# Altium project Palm_V2.2.PrjPcb (part 1 of 3)
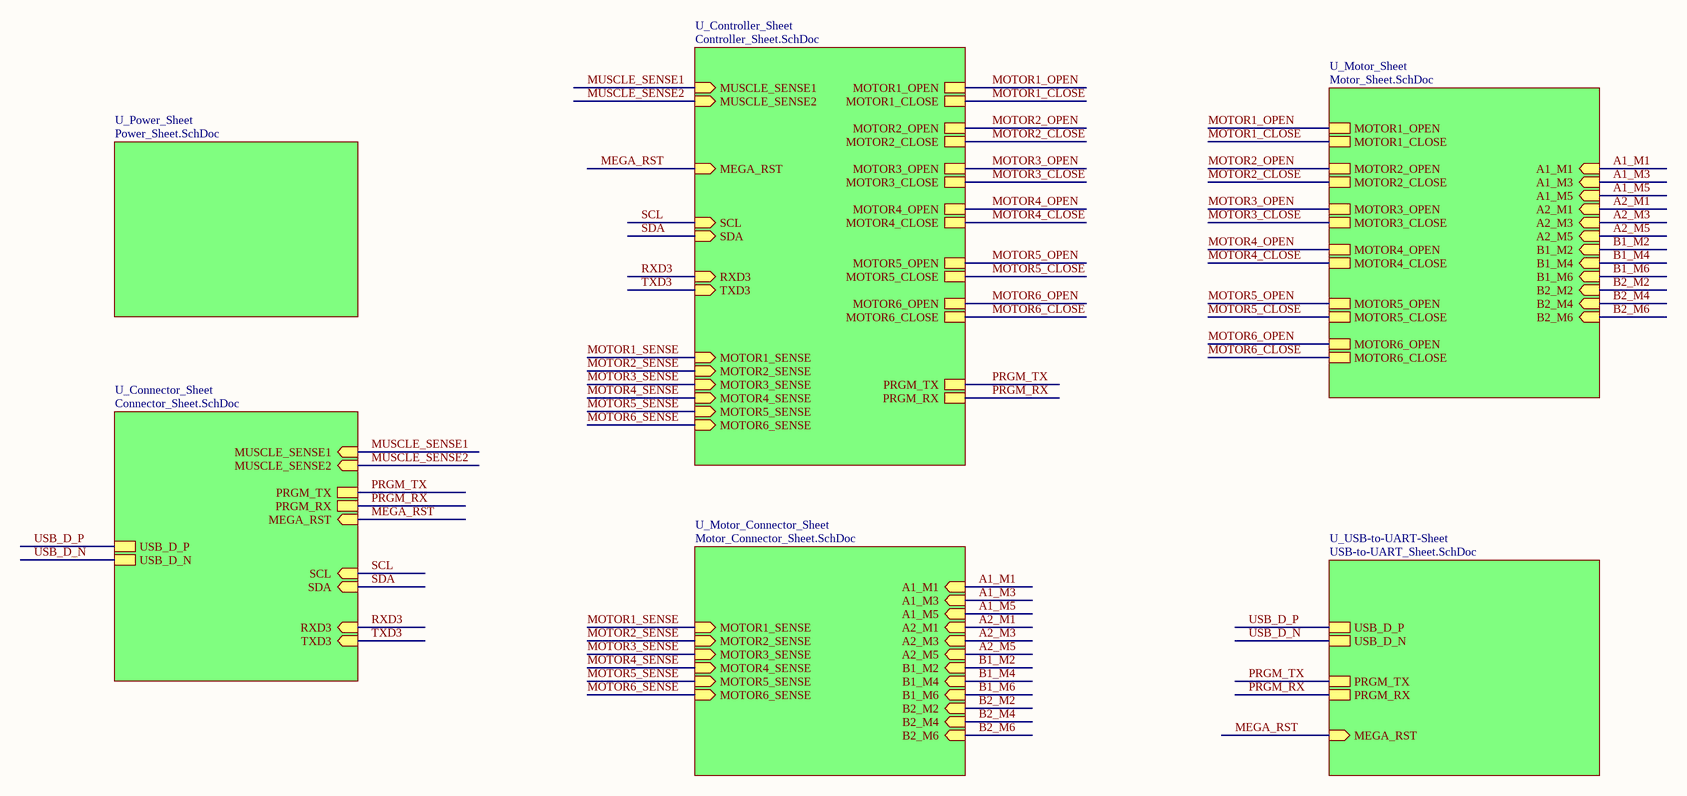
[diagram p0: Top_Sheet.SchDoc]
7 sheets, 124 parts. Net scope: hierarchical (ports join the sheet entries above them; power ports are global).
Board file: PCB_Palm_v2.2.PcbDoc
Sheets:
  Top_Sheet.SchDoc
    U_Power_Sheet = Power_Sheet.SchDoc
    U_Connector_Sheet = Connector_Sheet.SchDoc
    U_Motor_Connector_Sheet = Motor_Connector_Sheet.SchDoc
    U_Controller_Sheet = Controller_Sheet.SchDoc
    U_Motor_Sheet = Motor_Sheet.SchDoc
    U_USB-to-UART-Sheet = USB-to-UART_Sheet.SchDoc

## Sheet Top_Sheet.SchDoc
size B; DocumentNumber: 1; SheetNumber: 1; SheetTotal: 7

### Sub-sheets
U_Connector_Sheet = Connector_Sheet.SchDoc: MUSCLE_SENSE1 (in), SCL (in), SDA (in), MUSCLE_SENSE2 (in), RXD3 (in), TXD3 (in), PRGM_TX, PRGM_RX, MEGA_RST (in), USB_D_P, USB_D_N
U_Controller_Sheet = Controller_Sheet.SchDoc: MOTOR1_SENSE (in), MOTOR2_SENSE (in), MOTOR3_SENSE (in), MOTOR4_SENSE (in), MOTOR5_SENSE (in), MOTOR6_SENSE (in), MOTOR5_OPEN, MOTOR5_CLOSE, MOTOR6_OPEN, MOTOR6_CLOSE, MOTOR1_OPEN, MOTOR1_CLOSE, MOTOR2_OPEN, MOTOR2_CLOSE, MOTOR3_OPEN, MOTOR3_CLOSE, MOTOR4_OPEN, MOTOR4_CLOSE, SCL (in), SDA (in), RXD3 (in), TXD3 (in), MEGA_RST (in), MUSCLE_SENSE1 (in), MUSCLE_SENSE2 (in), PRGM_RX, PRGM_TX
U_Motor_Connector_Sheet = Motor_Connector_Sheet.SchDoc: MOTOR1_SENSE (in), MOTOR2_SENSE (in), MOTOR3_SENSE (in), MOTOR4_SENSE (in), MOTOR5_SENSE (in), MOTOR6_SENSE (in), B1_M6 (in), B2_M6 (in), A1_M5 (in), A2_M5 (in), B1_M4 (in), B2_M4 (in), A2_M3 (in), A1_M3 (in), B2_M2 (in), B1_M2 (in), A2_M1 (in), A1_M1 (in)
U_Motor_Sheet = Motor_Sheet.SchDoc: B2_M6 (in), B1_M6 (in), A2_M5 (in), A1_M5 (in), B2_M4 (in), B1_M4 (in), A2_M3 (in), A1_M3 (in), B2_M2 (in), B1_M2 (in), A2_M1 (in), A1_M1 (in), MOTOR6_CLOSE, MOTOR2_CLOSE, MOTOR2_OPEN, MOTOR4_OPEN, MOTOR5_CLOSE, MOTOR3_OPEN, MOTOR1_OPEN, MOTOR4_CLOSE, MOTOR3_CLOSE, MOTOR6_OPEN, MOTOR1_CLOSE, MOTOR5_OPEN
U_Power_Sheet = Power_Sheet.SchDoc: no entries
U_USB-to-UART-Sheet = USB-to-UART_Sheet.SchDoc: USB_D_P, USB_D_N, PRGM_RX, PRGM_TX, MEGA_RST (in)

### Nets
A1_M1: sheet U_Motor_Connector_Sheet/A1_M1, sheet U_Motor_Sheet/A1_M1
A1_M3: sheet U_Motor_Connector_Sheet/A1_M3, sheet U_Motor_Sheet/A1_M3
A1_M5: sheet U_Motor_Connector_Sheet/A1_M5, sheet U_Motor_Sheet/A1_M5
A2_M1: sheet U_Motor_Connector_Sheet/A2_M1, sheet U_Motor_Sheet/A2_M1
A2_M3: sheet U_Motor_Connector_Sheet/A2_M3, sheet U_Motor_Sheet/A2_M3
A2_M5: sheet U_Motor_Connector_Sheet/A2_M5, sheet U_Motor_Sheet/A2_M5
B1_M2: sheet U_Motor_Connector_Sheet/B1_M2, sheet U_Motor_Sheet/B1_M2
B1_M4: sheet U_Motor_Connector_Sheet/B1_M4, sheet U_Motor_Sheet/B1_M4
B1_M6: sheet U_Motor_Connector_Sheet/B1_M6, sheet U_Motor_Sheet/B1_M6
B2_M2: sheet U_Motor_Connector_Sheet/B2_M2, sheet U_Motor_Sheet/B2_M2
B2_M4: sheet U_Motor_Connector_Sheet/B2_M4, sheet U_Motor_Sheet/B2_M4
B2_M6: sheet U_Motor_Connector_Sheet/B2_M6, sheet U_Motor_Sheet/B2_M6
MEGA_RST: sheet U_Connector_Sheet/MEGA_RST, sheet U_Controller_Sheet/MEGA_RST, sheet U_USB-to-UART-Sheet/MEGA_RST
MOTOR1_CLOSE: sheet U_Controller_Sheet/MOTOR1_CLOSE, sheet U_Motor_Sheet/MOTOR1_CLOSE
MOTOR1_OPEN: sheet U_Controller_Sheet/MOTOR1_OPEN, sheet U_Motor_Sheet/MOTOR1_OPEN
MOTOR1_SENSE: sheet U_Motor_Connector_Sheet/MOTOR1_SENSE, sheet U_Controller_Sheet/MOTOR1_SENSE
MOTOR2_CLOSE: sheet U_Controller_Sheet/MOTOR2_CLOSE, sheet U_Motor_Sheet/MOTOR2_CLOSE
MOTOR2_OPEN: sheet U_Controller_Sheet/MOTOR2_OPEN, sheet U_Motor_Sheet/MOTOR2_OPEN
MOTOR2_SENSE: sheet U_Motor_Connector_Sheet/MOTOR2_SENSE, sheet U_Controller_Sheet/MOTOR2_SENSE
MOTOR3_CLOSE: sheet U_Controller_Sheet/MOTOR3_CLOSE, sheet U_Motor_Sheet/MOTOR3_CLOSE
MOTOR3_OPEN: sheet U_Controller_Sheet/MOTOR3_OPEN, sheet U_Motor_Sheet/MOTOR3_OPEN
MOTOR3_SENSE: sheet U_Motor_Connector_Sheet/MOTOR3_SENSE, sheet U_Controller_Sheet/MOTOR3_SENSE
MOTOR4_CLOSE: sheet U_Controller_Sheet/MOTOR4_CLOSE, sheet U_Motor_Sheet/MOTOR4_CLOSE
MOTOR4_OPEN: sheet U_Controller_Sheet/MOTOR4_OPEN, sheet U_Motor_Sheet/MOTOR4_OPEN
MOTOR4_SENSE: sheet U_Motor_Connector_Sheet/MOTOR4_SENSE, sheet U_Controller_Sheet/MOTOR4_SENSE
MOTOR5_CLOSE: sheet U_Controller_Sheet/MOTOR5_CLOSE, sheet U_Motor_Sheet/MOTOR5_CLOSE
MOTOR5_OPEN: sheet U_Controller_Sheet/MOTOR5_OPEN, sheet U_Motor_Sheet/MOTOR5_OPEN
MOTOR5_SENSE: sheet U_Motor_Connector_Sheet/MOTOR5_SENSE, sheet U_Controller_Sheet/MOTOR5_SENSE
MOTOR6_CLOSE: sheet U_Controller_Sheet/MOTOR6_CLOSE, sheet U_Motor_Sheet/MOTOR6_CLOSE
MOTOR6_OPEN: sheet U_Controller_Sheet/MOTOR6_OPEN, sheet U_Motor_Sheet/MOTOR6_OPEN
MOTOR6_SENSE: sheet U_Motor_Connector_Sheet/MOTOR6_SENSE, sheet U_Controller_Sheet/MOTOR6_SENSE
MUSCLE_SENSE1: sheet U_Connector_Sheet/MUSCLE_SENSE1, sheet U_Controller_Sheet/MUSCLE_SENSE1
MUSCLE_SENSE2: sheet U_Connector_Sheet/MUSCLE_SENSE2, sheet U_Controller_Sheet/MUSCLE_SENSE2
PRGM_RX: sheet U_Connector_Sheet/PRGM_RX, sheet U_Controller_Sheet/PRGM_RX, sheet U_USB-to-UART-Sheet/PRGM_RX
PRGM_TX: sheet U_Connector_Sheet/PRGM_TX, sheet U_Controller_Sheet/PRGM_TX, sheet U_USB-to-UART-Sheet/PRGM_TX
RXD3: sheet U_Connector_Sheet/RXD3, sheet U_Controller_Sheet/RXD3
SCL: sheet U_Connector_Sheet/SCL, sheet U_Controller_Sheet/SCL
SDA: sheet U_Connector_Sheet/SDA, sheet U_Controller_Sheet/SDA
TXD3: sheet U_Connector_Sheet/TXD3, sheet U_Controller_Sheet/TXD3
USB_D_N: sheet U_Connector_Sheet/USB_D_N, sheet U_USB-to-UART-Sheet/USB_D_N
USB_D_P: sheet U_Connector_Sheet/USB_D_P, sheet U_USB-to-UART-Sheet/USB_D_P

## Sheet Power_Sheet.SchDoc
size A; DocumentNumber: 2; SheetNumber: 2; SheetTotal: 7
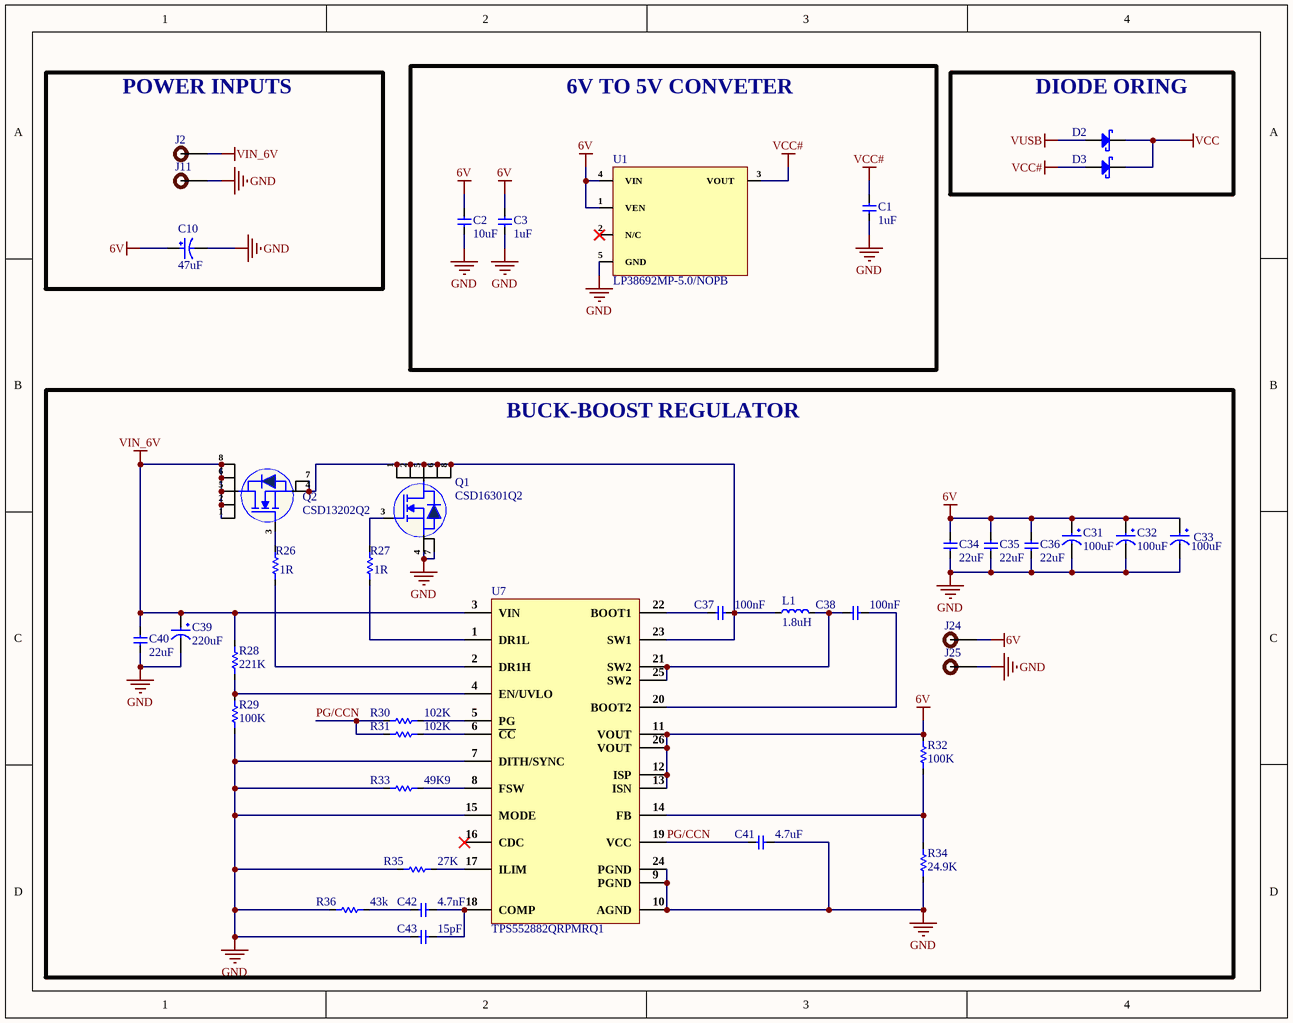
[diagram p1: Power_Sheet.SchDoc]

### Parts
C1  1uF  [Cap-0402]
C2  10uF  [Cap-0402]
C3  1uF  [Cap-0402]
C10  47uF  [Case-D]
C31  100uF  [Case-E]
C32  100uF  [Case-E]
C33  100uF  [Case-E]
C34  22uF  [Cap-0603]
C35  22uF  [Cap-0603]
C36  22uF  [Cap-0603]
C37  100nF  [Cap-0402]
C38  100nF  [Cap-0402]
C39  220uF  [Case-D]
C40  22uF  [Cap-0603]
C41  4.7uF  [Cap-0603]
C42  4.7nF  [Cap-0603]
C43  15pF  [Cap-0603]
D2  SS54B-HF  [SMB_]  (value not drawn)
D3  SS54B-HF  [SMB_]  (value not drawn)
J2  Test Point -TH 1.8mm Hole size 0.92mm  [Test Point -TH 1.8mm Hole size 0.92mm]  (value not drawn)  (no BOM)
J11  Test Point -TH 1.8mm Hole size 0.92mm  [Test Point -TH 1.8mm Hole size 0.92mm]  (value not drawn)  (no BOM)
J24  Test Point -TH 1.8mm Hole size 0.92mm  [Test Point -TH 1.8mm Hole size 0.92mm]  (value not drawn)  (no BOM)
J25  Test Point -TH 1.8mm Hole size 0.92mm  [Test Point -TH 1.8mm Hole size 0.92mm]  (value not drawn)  (no BOM)
L1  1.8uH  [YSPIT0770A-1R8M]
Q1  CSD16301Q2  [CSD17313Q2]
Q2  CSD13202Q2  [CSD17313Q2]
R26  1R  [Res-0603]
R27  1R  [Res-0603]
R28  221K  [Res-0603]
R29  100K  [Res-0603]
R30  102K  [Res-0603]
R31  102K  [Res-0603]
R32  100K  [Res-0603]
R33  49K9  [Res-0603]
R34  24.9K  [Res-0402]
R35  27K  [Res-0603]
R36  43k  [Res-0402]
U1  LP38692MP-5.0/NOPB  [SOT-223-5]
U7  TPS552882QRPMRQ1  [26-VQFN-HR (4x3.5)]

### Blocks framed on the sheet
POWER INPUTS: C10 J2 J11
6V TO 5V CONVETER: C1-C3 U1
DIODE ORING: D2 D3
BUCK-BOOST REGULATOR: C31-C43 J24 J25 L1 Q1 Q2 R26-R36 U7

### Nets
6V: C2.2 C3.2 C10.1 C31.1 C32.1 C33.1 C34.2 C35.2 C36.2 J24.1 R32.2 U1.1(VEN) U1.4(VIN) U7.11(VOUT) U7.12(ISP) U7.13(ISN) U7.26(VOUT)
GND: C1.1 C2.1 C3.1 C10.2 C31.2 C32.2 C33.2 C34.1 C35.1 C36.1 C39.2 C40.1 C41.2 C43.1 J11.1 J25.1 Q1.4(S) Q1.7(S) R29.1 R33.1 R34.1 R35.1 R36.1 U1.5(GND) U7.7(DITH/SYNC) U7.9(PGND) U7.10(AGND) U7.15(MODE) U7.24(PGND)
VCC: D2.2(K) D3.2(K)
VCC#: C1.2 D3.1(A) U1.3(VOUT)
VIN_6V: C39.1 C40.2 J2.1 Q2.1(D) Q2.2(D) Q2.5(D) Q2.6(D) Q2.8(D) R28.2 U7.3(VIN)
VUSB: D2.1(A)
PG/CCN: C41.1 R30.1 R31.1 U7.19(VCC)
NetC37_1: C37.1 U7.22(BOOT1)
NetC37_2: C37.2 L1.1 Q1.1(D) Q1.2(D) Q1.5(D) Q1.6(D) Q1.8(D) Q2.4(S) Q2.7(S) U7.23(SW1)
NetC38_1: C38.1 L1.2 U7.21(SW2) U7.25(SW2)
NetC38_2: C38.2 U7.20(BOOT2)
NetC42_1: C42.1 R36.2
NetC42_2: C42.2 C43.2 U7.18(COMP)
NetQ1_3: Q1.3(G) R27.2
NetQ2_3: Q2.3(G) R26.2
NetR26_1: R26.1 U7.2(DR1H)
NetR27_1: R27.1 U7.1(DR1L)
NetR28_1: R28.1 R29.2 U7.4(EN/UVLO)
NetR30_2: R30.2 U7.5(PG)
NetR31_2: R31.2 U7.6(~{CC})
NetR32_1: R32.1 R34.2 U7.14(FB)
NetR33_2: R33.2 U7.8(FSW)
NetR35_2: R35.2 U7.17(ILIM)

Not connected (* = marked no-connect by the designer): U1 2(N/C)*; U7 16(CDC)*

### Library data of the parts
C1 C3 = CC0402KRX5R6BB105: CAP CER 1UF 10V X5R 0402; Manufacturer: Yageo; Tolerance: 10%; Dissipation Factor: 15%; Item Type: Capacitor; Supplier 1: Mouser; Manufacturer Part Number: CC0402KRX5R6BB105; RoHS: Yes; Category: Ceramic Capacitors; Stock 1: 6711367; Pricing 1: 1=0.11000, 10=0.05500, 50=0.05500, 100=0.03300, 500=0.02700, 1000=0.02200, 2500=0.02100, 10000=0.01800 (USD); Mount: Surface Mount; Case/Package: 0402; Number of Pins: 2; Case Code (Metric): 1005; Case Code (Imperial): 0402; Min Operating Temperature: -55°C; Max Operating Temperature: 85°C; Capacitance: 1uF; Dielectric: X5R; Package Quantity: 1; Voltage Rating: 10V; Packaging: Tape and Reel; Voltage Rating (DC): 10V; Termination: SMD/SMT; Resistor Type: Ceramic; Series: CC; Construction: Flat; Length: 1mm; Width: 0.02inch; Height: 0.5mm; Thickness: 0.022inch; Depth: 0.5mm; Radiation Hardening: No; REACH SVHC: No SVHC; Lead Free: Lead Free; Halogen Free: Halogen Free; RoHS Compliant: Yes; ComponentLink1URL: https://datasheet.ciiva.com/176/upy-gphc-x5r-4v-to-50v-12-176704.pdf?src-supplier=Digi-Key; ComponentLink1Description: https://datasheet.ciiva.com/176/upy-gphc-x5r-4v-to-50v-12-176704.pdf?src-supplier=Digi-Key; ComponentLink2URL: https://datasheet.ciiva.com/176/mlccorderingcode-176705.pdf?src-supplier=Digi-Key; ComponentLink2Description: https://datasheet.ciiva.com/176/mlccorderingcode-176705.pdf?src-supplier=Digi-Key; ComponentLink3URL: https://datasheet.ciiva.com/176/mlccorderingcode-176706.pdf?src-supplier=Digi-Key; ComponentLink3Description: https://datasheet.ciiva.com/176/mlccorderingcode-176706.pdf?src-supplier=Digi-Key; Supplier Part Number 1: 603-CC402KRX5R6BB105; LCSC Part Number: C106254
C2 = CC0402MRX5R6BB106: CAP CER 10UF 10V X5R 0402; Manufacturer: Yageo; Tolerance: 20%; Item Type: Capacitor; Supplier 1: Future Electronics; Manufacturer Part Number: CC0402MRX5R6BB106; RoHS: Yes; Category: Ceramic Capacitors; Stock 1: 80000; Pricing 1: 10000=0.02650, 20000=0.02590, 30000=0.02550, 40000=0.02530, 50000=0.02450 (USD); Mount: Surface Mount; Case/Package: 0402; Case Code (Imperial): 0402; Case Code (Metric): 1005; Min Operating Temperature: -55°C; Max Operating Temperature: 85°C; Packaging: Tape and Reel; Capacitance: 10uF; Voltage Rating: 10V; RoHS Compliant: Yes; ComponentLink1URL: http://www.yageo.com/documents/recent/UPY-GPHC_X5R_4V-to-50V_25.pdf?src-supplier=Digi-Key; ComponentLink1Description: http://www.yageo.com/documents/recent/UPY-GPHC_X5R_4V-to-50V_25.pdf?src-supplier=Digi-Key; Supplier Part Number 1: 6097631; LCSC Part Number: C962143
C10 = CA45-D025K476T: 47uF 25V 0.9Ω@100kHz ±10% CASE-D-7343 Tantalum Capacitors ROHS; Manufacturer: Hunan Xiangyee in S&T; Manufacturer Part Number: CA45-D025K476T; ComponentLink1URL: https://www.lcsc.com/product-detail/Tantalum-Capacitors_Hunan-Xiangyee-in-S-T-CA45-D025K476T_C123267.html; ComponentLink1Description: LCSC; LCSC Part Number: C123267; Item Type: Capacitor; Package: CASE-D-7343
C31-C33 = TAJE107M025RNJ: CAP TANT 100UF 20% 25V 2917; Manufacturer: Kyocera AVX; ESR (Equivalent Series Resistance): 300mR; Leakage Current: 25uA; Polarity: Polar; Dissipation Factor: 10%; Supplier 1: Mouser; Manufacturer Part Number: TAJE107M025RNJ; RoHS: Yes; Category: Tantalum Capacitors; Stock 1: 109; Pricing 1: 1=2.81000, 10=2.81000, 50=2.81000, 100=2.19000, 1000=1.76000, 10000=1.76000 (USD); Mount: Surface Mount; Case/Package: 2917; Number of Pins: 2; Case Code (Imperial): 2917; Case Code (Metric): 7343; Min Operating Temperature: -55°C; Max Operating Temperature: 125°C; Capacitance: 100uF; Tolerance: 20%; Packaging: Tape and Reel; Voltage Rating: 25V; Voltage Rating (DC): 25V; Features: General Purpose; Package Quantity: 1; Termination: SMD/SMT; Series: TAJ; Construction: Flat; Length: 7.3mm; Width: 4.3mm; Height: 4.3mm; Depth: 4.3mm; Height - Seated (Max): 0.169inch; Radiation Hardening: No; Lead Free: Lead Free; RoHS Compliant: Yes; REACH SVHC: No SVHC; ComponentLink1URL: https://datasheet.ciiva.com/26787/taje107m025rnj-26787048.pdf?src-supplier=IIIC; ComponentLink1Description: https://datasheet.ciiva.com/26787/taje107m025rnj-26787048.pdf?src-supplier=IIIC; ComponentLink2URL: https://datasheet.ciiva.com/265/taj-265541.pdf?src-supplier=Digi-Key; ComponentLink2Description: https://datasheet.ciiva.com/265/taj-265541.pdf?src-supplier=Digi-Key; ComponentLink3URL: https://datasheet.ciiva.com/265/taj-265542.pdf?src-supplier=Digi-Key; ComponentLink3Description: https://datasheet.ciiva.com/265/taj-265542.pdf?src-supplier=Digi-Key; ComponentLink4URL: https://datasheet.ciiva.com/265/taj-265540.pdf?src-supplier=Digi-Key; ComponentLink4Description: https://datasheet.ciiva.com/265/taj-265540.pdf?src-supplier=Digi-Key; ComponentLink5URL: https://datasheet.ciiva.com/28609/1719052-28609254.pdf?src-supplier=Element14; ComponentLink5Description: https://datasheet.ciiva.com/28609/1719052-28609254.pdf?src-supplier=Element14; ComponentLink6URL: https://datasheet.ciiva.com/11230/taj-11230456.pdf?src-supplier=Avnet; ComponentLink6Description: https://datasheet.ciiva.com/11230/taj-11230456.pdf?src-supplier=Avnet; ComponentLink7URL: https://datasheet.ciiva.com/17339/taj-17339677.pdf?src-supplier=Avnet+Europe; ComponentLink7Description: https://datasheet.ciiva.com/17339/taj-17339677.pdf?src-supplier=Avnet+Europe; ComponentLink8URL: https://datasheet.ciiva.com/22667/1719052-22667581.pdf?src-supplier=Element14; ComponentLink8Description: https://datasheet.ciiva.com/22667/1719052-22667581.pdf?src-supplier=Element14; Supplier Part Number 1: 581-TAJE107M025RNJ; LCSC Part Number: C7230
C34-C36 C40 = CL10A226MO7JZNC: CAP CER 22UF 16V X5R 0603; Manufacturer: Samsung; Item Type: Capacitors; Material: 4241ConductorMaterial; Tolerance: 20%; Supplier: Digikey; LCSC Part Number: C2762594; Manufacturer Part Number: CL10A226MO7JZNC; RoHS: Yes; Stock: 944984; Pricing: 1=0.65, 10=0.391, 50=0.2884, 100=0.2564, 500=0.20198, 1000=0.18499 (USD); Mounting Technology: Surface Mount; Case/Package: 0603; Case Code (Imperial): 0603; Case Code (Metric): 1608; Min Operating Temperature: -55°C; Max Operating Temperature: 85°C; Packaging: Cut Tape; Value: 22uF; Voltage Rating: 16V; Series: CL; Height: 900um; RoHS Compliant: Yes; ComponentLink1URL: http://www.samsungsem.com/kr/support/product-search/mlcc/CL10A226MO7JZNC.jsp?src-supplier=Digikey; ComponentLink1Description: http://www.samsungsem.com/kr/support/product-search/mlcc/CL10A226MO7JZNC.jsp?src-supplier=Digikey; ComponentLink2URL: https://datasheet.octopart.com/CL10A226MO7JZNC-Samsung-Electro-Mechanics-datasheet-149156497.pdf?src-supplier=Future+Electronics; ComponentLink2Description: https://datasheet.octopart.com/CL10A226MO7JZNC-Samsung-Electro-Mechanics-datasheet-149156497.pdf?src-supplier=Future+Electronics
C37 C38 = CC0402KRX5R8BB104: CAP CER 0.1UF 25V X5R 0402; Manufacturer: Yageo; Tolerance: 10%; Item Type: Capacitor; Supplier 1: Digi-Key; Manufacturer Part Number: CC0402KRX5R8BB104; RoHS: Yes; Category: Ceramic Capacitors; Stock 1: 4598218; Pricing 1: 1=0.10000, 10=0.03800, 50=0.02100, 100=0.01710, 500=0.01224, 1000=0.00961, 2500=0.00874, 5000=0.00804 (USD); Mount: Surface Mount; Case/Package: 0402; Case Code (Metric): 1005; Case Code (Imperial): 0402; Min Operating Temperature: -55°C; Max Operating Temperature: 85°C; Voltage Rating: 25V; Packaging: Tape and Reel; Capacitance: 100nF; Voltage Rating (DC): 25V; Dielectric: X5R; Resistor Type: Ceramic; Series: CC; Length: 0.039inch; Width: 0.02inch; Thickness: 0.022inch; Depth: 0.5mm; Lead Free: Lead Free; Halogen Free: Halogen Free; RoHS Compliant: Yes; ComponentLink1URL: http://www.mouser.com/ds/2/447/UPY-GPHC_X5R_4V-to-50V_25-1131599.pdf?src-supplier=Mouser; ComponentLink1Description: http://www.mouser.com/ds/2/447/UPY-GPHC_X5R_4V-to-50V_25-1131599.pdf?src-supplier=Mouser; ComponentLink2URL: http://www.yageo.com/documents/recent/UPY-GPHC_X5R_4V-to-50V-16.pdf?src-supplier=Future+Electronics; ComponentLink2Description: http://www.yageo.com/documents/recent/UPY-GPHC_X5R_4V-to-50V-16.pdf?src-supplier=Future+Electronics; ComponentLink3URL: http://www.yageo.com/documents/recent/UPY-GPHC_X5R_4V-to-50V_25.pdf?src-supplier=Digi-Key; ComponentLink3Description: http://www.yageo.com/documents/recent/UPY-GPHC_X5R_4V-to-50V_25.pdf?src-supplier=Digi-Key; Supplier Part Number 1: 311-1697-1-ND; LCSC Part Number: C106256
C39 = T491X227K016AT: CAP TANT 220UF 10% 16V 2917; Manufacturer: KEMET; Item Type: Capacitor; Manufacturer Part Number: T491X227K016AT; LCSC Part Number: C122311; ComponentLink1Description: LCSC; ComponentLink1URL: https://www.lcsc.com/product-detail/Tantalum-Capacitors_KEMET-T491X227K016AT_C122311.html
C41 = GRM188C71C475KE21D: CAP CER 4.7UF 16V X7S 0603; Manufacturer: Murata; Item Type: Capacitors; Material: 4241ConductorMaterial; Tolerance: 10%; Dielectric: 1542DielectricType; Supplier: Mouser; LCSC Part Number: C237615; Manufacturer Part Number: GRM188C71C475KE21D; RoHS: Yes; Stock: 23513; Pricing: 1=0.27, 10=0.113, 50=0.113, 100=0.075, 1000=0.067, 10000=0.046 (USD); Mounting Technology: Surface Mount; Case/Package: 0603; Min Operating Temperature: -55°C; Max Operating Temperature: 125°C; Series: GRM; Voltage Rating: 16V; Voltage Rating (DC): 16V; Value: 4.7uF; Length: 1.6mm; Width: 800um; Height: 950um; Thickness: 800um; RoHS Compliant: Yes; ComponentLink1URL: http://search.murata.co.jp/Ceramy/image/img/A01X/G101/ENG/GRM188C71C475KE21-01.pdf?src-supplier=Digikey; ComponentLink1Description: http://search.murata.co.jp/Ceramy/image/img/A01X/G101/ENG/GRM188C71C475KE21-01.pdf?src-supplier=Digikey
C42 = CC0603KRX7R0BB472: CAP CER 4700PF 100V X7R 0603; Manufacturer: Yageo; Item Type: Capacitor; Dielectric Material: 4241ConductorMaterial; Supplier: Digikey; LCSC Part Number: C115052; Manufacturer Part Number: CC0603KRX7R0BB472; RoHS: Yes; Stock: 67499; Pricing: 1=0.1, 10=0.05, 50=0.0288, 100=0.0223, 500=0.0168, 1000=0.01319 (USD); Voltage Rating (AC): 100V; Lead Free: 5697LeadFree; ComponentLink1URL: https://datasheet.ciiva.com/8033/1669968-8033781.pdf?src-supplier=Element14; ComponentLink1Description: https://datasheet.ciiva.com/8033/1669968-8033781.pdf?src-supplier=Element14
C43 = CC0603JRNPO9BN150: CAP CER 15PF 50V C0G/NPO 0603; Manufacturer: Yageo; Dielectric Material: Ceramic; Tolerance: 5%; Dielectric: C0G; Insulation Resistance: 100GR; Item Type: Capacitor; Supplier 1: Future Electronics; Manufacturer Part Number: CC0603JRNPO9BN150; RoHS: Yes; Category: Ceramic Capacitors; Stock 1: 832000; Pricing 1: 4000=0.0038, 16000=0.0036, 80000=0.0034, 160000=0.0033, 500000=0.0031 (USD); Mounting Technology: Surface Mount; Case/Package: 0603; Pins: 2; Case Code (Metric): 1608; Case Code (Imperial): 0603; Min Operating Temperature: -55°C; Max Operating Temperature: 125°C; Value: 15pF; Series: CC; Packaging: Tape and Reel; Package Quantity: 1; Termination: SMD/SMT; Voltage Rating: 50V; Length: 1.6mm; Width: 0.031inch; Height: 0.8mm; Depth: 0.8mm; Thickness: 0.035inch; Radiation Hardening: No; RoHS Compliant: Yes; Reach SVHC Compliant: No; Lead Free: Lead Free; ComponentLink1URL: https://datasheet.ciiva.com/144/mlccorderingcode-144635.pdf?src-supplier=Digi-Key; ComponentLink1Description: https://datasheet.ciiva.com/144/mlccorderingcode-144635.pdf?src-supplier=Digi-Key; ComponentLink2URL: https://datasheet.ciiva.com/144/mlccorderingcode-144636.pdf?src-supplier=Digi-Key; ComponentLink2Description: https://datasheet.ciiva.com/144/mlccorderingcode-144636.pdf?src-supplier=Digi-Key; ComponentLink3URL: https://datasheet.ciiva.com/8033/1443161-8033721.pdf?src-supplier=Element14; ComponentLink3Description: https://datasheet.ciiva.com/8033/1443161-8033721.pdf?src-supplier=Element14; ComponentLink4URL: https://datasheet.ciiva.com/28450/1443161-28450472.pdf?src-supplier=Element14; ComponentLink4Description: https://datasheet.ciiva.com/28450/1443161-28450472.pdf?src-supplier=Element14; ComponentLink5URL: https://datasheet.ciiva.com/144/mlccorderingcode-144634.pdf?src-supplier=Digi-Key; ComponentLink5Description: https://datasheet.ciiva.com/144/mlccorderingcode-144634.pdf?src-supplier=Digi-Key; ComponentLink6URL: https://datasheet.ciiva.com/8033/1734582-8033723.pdf?src-supplier=Element14; ComponentLink6Description: https://datasheet.ciiva.com/8033/1734582-8033723.pdf?src-supplier=Element14; ComponentLink7URL: https://datasheet.ciiva.com/8033/1734582-8033722.pdf?src-supplier=Element14; ComponentLink7Description: https://datasheet.ciiva.com/8033/1734582-8033722.pdf?src-supplier=Element14; ComponentLink8URL: https://datasheet.ciiva.com/11464/upy-gp-np0-16v-to-50v-8-11464727.pdf?src-supplier=Avnet; ComponentLink8Description: https://datasheet.ciiva.com/11464/upy-gp-np0-16v-to-50v-8-11464727.pdf?src-supplier=Avnet; Supplier Part Number 1: 4234670; LCSC Part Number: C107037
D2 D3 = SS54B-HF: DIODE SCHOTTKY 5A 40V SMB; Manufacturer: Comchip; Supplier 1: Mouser; Manufacturer Part Number: SS54B-HF; RoHS: No; Stock 1: 2862; Pricing 1: 1=0.56000, 10=0.32900, 50=0.32900, 100=0.17100, 1000=0.11900, 10000=0.09000 (USD); Supplier Part Number 1: 750-SS54B-HF; LCSC Part Number: C3759253
L1 = YSPIT0770A-1R8M: 21A 1.8uH Integrated molded inductor ±20% 25A SMD,7.8x7.6mm Power Inductors ROHS; Manufacturer: YJYCOIN; Manufacturer Part Number: YSPIT0770A-1R8M; Item Type: Inductors; Value: 1.8uH; ComponentLink1Description: LCSC; ComponentLink1URL: http://lcsc.com/product-detail/Power-Inductors_YJYCOIN-YSPIT0770A-1R8M_C19630747.html
Q1 = CSD16301Q2: 25-V, N channel NexFET™ power MOSFET, single SON 2 mm x 2 mm, 29 mOhm 6-WSON -55 to 150; Manufacturer: Texas Instruments; Number of Channels: 1NUMBER; Supplier: Mouser; Supplier Part Number: 595-CSD16301Q2; Manufacturer Part Number: CSD16301Q2; RoHS: Yes; Category: MOSFETs; Stock: 34585; Pricing: 1=0.48, 10=0.312, 50=0.312, 100=0.298, 1000=0.196, 10000=0.145 (USD); Thickness: 750um; ComponentLink1URL: https://datasheet.ciiva.com/22698/1536215-22698017.pdf?src-supplier=Element14; ComponentLink1Description: https://datasheet.ciiva.com/22698/1536215-22698017.pdf?src-supplier=Element14; ComponentLink2URL: https://datasheet.ciiva.com/4438/slps235c-122185-4438227.pdf?src-supplier=Mouser; ComponentLink2Description: https://datasheet.ciiva.com/4438/slps235c-122185-4438227.pdf?src-supplier=Mouser; ComponentLink3URL: https://datasheet.ciiva.com/6388/csd16301q2-6388192.pdf?src-supplier=Digikey; ComponentLink3Description: https://datasheet.ciiva.com/6388/csd16301q2-6388192.pdf?src-supplier=Digikey; ComponentLink4URL: https://datasheet.ciiva.com/14192/slps235c-14192869.pdf?src-supplier=Avnet; ComponentLink4Description: https://datasheet.ciiva.com/14192/slps235c-14192869.pdf?src-supplier=Avnet; ComponentLink5URL: https://datasheet.ciiva.com/7968/1536215-7968247.pdf?src-supplier=Element14; ComponentLink5Description: https://datasheet.ciiva.com/7968/1536215-7968247.pdf?src-supplier=Element14; ComponentLink6URL: https://datasheet.ciiva.com/6388/csd16301q2-6388189.pdf?src-supplier=Digikey; ComponentLink6Description: https://datasheet.ciiva.com/6388/csd16301q2-6388189.pdf?src-supplier=Digikey
Q2 = CSD13202Q2: MOSFET N-CH 12V 22A 6WSON; Manufacturer: Texas Instruments; Supplier: Mouser; Supplier Part Number: 595-CSD13202Q2; Manufacturer Part Number: CSD13202Q2; RoHS: Yes; Category: MOSFETs; Stock: 5521; Pricing: 1=0.53, 10=0.375, 50=0.375, 100=0.265, 1000=0.187, 10000=0.152 (USD); ComponentLink1URL: https://datasheet.ciiva.com/30021/csd13202q2-30021962.pdf?src-supplier=Avnet; ComponentLink1Description: https://datasheet.ciiva.com/30021/csd13202q2-30021962.pdf?src-supplier=Avnet; ComponentLink2URL: https://datasheet.ciiva.com/29747/csd13202q2-29747563.pdf?src-supplier=Digikey; ComponentLink2Description: https://datasheet.ciiva.com/29747/csd13202q2-29747563.pdf?src-supplier=Digikey
R26 R27 = CRCW06031R00FKEA: RES SMD 1 OHM 1% 1/10W 0603; Manufacturer: Vishay Dale; Item Type: Resistor; Power Rating: 100mW; Voltage Rating: 75V; Temperature Coefficient: 100ppm/°C; Supplier: Mouser; LCSC Part Number: C844752; Manufacturer Part Number: CRCW06031R00FKEA; RoHS: Yes; Stock: 303523; Pricing: 1=0.1, 10=0.024, 50=0.024, 100=0.014, 1000=0.011, 10000=0.006 (USD); Case/Package: 0603; Pins: 2; Contact Plating: Tin; Weight: 7.1E-05oz; Case Code (Metric): 1608; Case Code (Imperial): 0603; Min Operating Temperature: -55°C; Max Operating Temperature: 155°C; Value: 1R; Tolerance: 1%; Resistor Type: Thick Film; Termination: SMD/SMT; Voltage Rating (DC): 75V; Packaging: Tape and Reel; Number of Terminations: 2; Max Power Dissipation: 100mW; Features: Automotive AEC-Q200; Series: CRCW; Construction: Rectangular; Resistance Tolerance: 1%; Package Quantity: 5000; Length: 1.55mm; Width: 0.85mm; Height: 0.45mm; Depth: 0.85mm; Ratings: AEC-Q200; Radiation Hardening: No; Lead Free: 5697LeadFree; RoHS Compliant: Yes; Military Standard: Not; Reach SVHC Compliant: Unknown; ComponentLink1URL: https://datasheet.ciiva.com/7792/1359337-7792119.pdf?src-supplier=Element14; ComponentLink1Description: https://datasheet.ciiva.com/7792/1359337-7792119.pdf?src-supplier=Element14; ComponentLink2URL: https://datasheet.ciiva.com/3257/dcrcwe3-3257225.pdf?src-supplier=Avnet; ComponentLink2Description: https://datasheet.ciiva.com/3257/dcrcwe3-3257225.pdf?src-supplier=Avnet; ComponentLink3URL: https://datasheet.ciiva.com/2465/dcrcwe3-2465530.pdf?src-supplier=Digikey; ComponentLink3Description: https://datasheet.ciiva.com/2465/dcrcwe3-2465530.pdf?src-supplier=Digikey; ComponentLink4URL: https://datasheet.ciiva.com/2465/dcrcwe3-2465528.pdf?src-supplier=Digikey; ComponentLink4Description: https://datasheet.ciiva.com/2465/dcrcwe3-2465528.pdf?src-supplier=Digikey; ComponentLink5URL: https://datasheet.ciiva.com/5541/dcrcwe3-109170-5541726.pdf?src-supplier=Mouser; ComponentLink5Description: https://datasheet.ciiva.com/5541/dcrcwe3-109170-5541726.pdf?src-supplier=Mouser
R28 = AC0603FR-07221KL: RES SMD 221K OHM 1% 1/10W 0603; Manufacturer: Yageo; Item Type: Resistor; Supplier: Avnet; Supplier Part Number: AC0603FR-07221KL; Manufacturer Part Number: AC0603FR-07221KL; RoHS: Yes; Category: Chip SMD Resistors; Stock: 1875000; Pricing: 5000=0.00174, 10000=0.00171, 20000=0.00166 (USD); ComponentLink1URL: http://www.mouser.com/ds/2/447/yageodocoutput-1111992.pdf?src-supplier=Mouser; ComponentLink1Description: http://www.mouser.com/ds/2/447/yageodocoutput-1111992.pdf?src-supplier=Mouser; ComponentLink2URL: https://datasheet.octopart.com/AC0603FR-07221KL-Yageo-datasheet-151884373.pdf?src-supplier=Future+Electronics; ComponentLink2Description: https://datasheet.octopart.com/AC0603FR-07221KL-Yageo-datasheet-151884373.pdf?src-supplier=Future+Electronics; ComponentLink3URL: http://www.yageo.com/documents/recent/PYu-AC_51_RoHS_L_2.pdf?src-supplier=Future+Electronics; ComponentLink3Description: http://www.yageo.com/documents/recent/PYu-AC_51_RoHS_L_2.pdf?src-supplier=Future+Electronics; ComponentLink4URL: http://www.yageo.com/NewPortal/yageodocoutput?fileName=/pdf/R-Chip/PYu-AC_51_RoHS_L_6.pdf&src-supplier=Digi-Key; ComponentLink4Description: http://www.yageo.com/NewPortal/yageodocoutput?fileName=/pdf/R-Chip/PYu-AC_51_RoHS_L_6.pdf&src-supplier=Digi-Key; LCSC Part Number: C227712
R29 R32 = CRCW0603100KFKEA: RES SMD 100K OHM 1% 1/10W 0603; Item Type: Resistor; Value: 100kR; Temperature Coefficient: 100ppm/°C; Voltage Rating: 75V; Power Rating: 100mW; ComponentLink1Description: LCSC; Supplier: Mouser; Supplier Part Number: 71-CRCW0603-100K-E3; RoHS: Yes; Category: Chip SMD Resistors; Stock: 716604; Pricing: 1=0.1, 10=0.019, 50=0.019, 100=0.009, 1000=0.007, 10000=0.004 (USD); Case/Package: 345Case; Pins: 2NUMBER; Case Code (Imperial): 0603; Case Code (Metric): 1608; Min Operating Temperature: -55°C; Max Operating Temperature: 155°C; Tolerance: 1%; Resistor Type: Thick Film; Resistance Tolerance: 1%; Packaging: 13Packaging; Voltage Rating (DC): 75V; Features: 6309FeaturesType; Height: 500um; RoHS Compliant: Yes; Lead Free: 5697LeadFree; ComponentLink2URL: http://www.farnell.com/datasheets/2310790.pdf?src-supplier=Farnell; ComponentLink2Description: http://www.farnell.com/datasheets/2310790.pdf?src-supplier=Farnell; ComponentLink3URL: https://datasheet.octopart.com/CRCW0603100KFKEA-Vishay-datasheet-14722531.pdf?src-supplier=Newark; ComponentLink3Description: https://datasheet.octopart.com/CRCW0603100KFKEA-Vishay-datasheet-14722531.pdf?src-supplier=Newark; ComponentLink4URL: https://www.vishay.com/docs/20035/dcrcwe3.pdf?src-supplier=Digi-Key; ComponentLink4Description: https://www.vishay.com/docs/20035/dcrcwe3.pdf?src-supplier=Digi-Key; ComponentLink5URL: https://datasheet.octopart.com/CRCW0603100KFKEA-Vishay-datasheet-5300368.pdf?src-supplier=Future+Electronics; ComponentLink5Description: https://datasheet.octopart.com/CRCW0603100KFKEA-Vishay-datasheet-5300368.pdf?src-supplier=Future+Electronics; ComponentLink6URL: http://www.farnell.com/datasheets/2310790.pdf?src-supplier=Newark; ComponentLink6Description: http://www.farnell.com/datasheets/2310790.pdf?src-supplier=Newark; ComponentLink7URL: http://www.farnell.com/datasheets/2310790.pdf?src-supplier=Element14; ComponentLink7Description: http://www.farnell.com/datasheets/2310790.pdf?src-supplier=Element14; ComponentLink8URL: https://datasheet.octopart.com/CRCW0603100KFKEA-Vishay-datasheet-83961561.pdf?src-supplier=Element14; ComponentLink8Description: https://datasheet.octopart.com/CRCW0603100KFKEA-Vishay-datasheet-83961561.pdf?src-supplier=Element14; ComponentLink9URL: https://datasheet.octopart.com/CRCW0603100KFKEA-Vishay-datasheet-8363642.pdf?src-supplier=Verical; ComponentLink9Description: https://datasheet.octopart.com/CRCW0603100KFKEA-Vishay-datasheet-8363642.pdf?src-supplier=Verical; ComponentLink10URL: https://datasheet.octopart.com/CRCW0603100KFKEA-Vishay-datasheet-508714.pdf?src-supplier=Farnell; ComponentLink10Description: https://datasheet.octopart.com/CRCW0603100KFKEA-Vishay-datasheet-508714.pdf?src-supplier=Farnell; ComponentLink11URL: https://datasheet.octopart.com/CRCW0603100KFKEA-Vishay-datasheet-17834126.pdf?src-supplier=TME; ComponentLink11Description: https://datasheet.octopart.com/CRCW0603100KFKEA-Vishay-datasheet-17834126.pdf?src-supplier=TME; LCSC Part Number: C844916
R30 R31 = RT0603BRE07102KL: RES SMD 102K OHM 0.1% 1/10W 0603; Manufacturer: Yageo; Item Type: Resistor; Value: 102kR; Max Power Dissipation: 100mW; Temperature Coefficient: 50ppm/°C; Voltage Rating (DC): 50V; Supplier: Digikey; LCSC Part Number: C861617; Manufacturer Part Number: RT0603BRE07102KL; RoHS: Yes; Pricing: 5000=0.04446 (USD); Case/Package: 0603; Contact Plating: Tin,Matte; Min Operating Temperature: -55°C; Max Operating Temperature: 155°C; Packaging: Tape and Reel; Tolerance: 0.1%; Number of Terminations: 2; Series: RT; Lead Free: Lead Free; RoHS Compliant: Yes; ComponentLink1URL: https://datasheet.ciiva.com/2584/pyu-rt-1-to-0-05-rohs-l-5-2584160.pdf?src-supplier=Digikey; ComponentLink1Description: https://datasheet.ciiva.com/2584/pyu-rt-1-to-0-05-rohs-l-5-2584160.pdf?src-supplier=Digikey; ComponentLink2URL: https://datasheet.ciiva.com/8887/pyu-rt-1-to-0-05-rohs-l-4-8887854.pdf?src-supplier=Avnet; ComponentLink2Description: https://datasheet.ciiva.com/8887/pyu-rt-1-to-0-05-rohs-l-4-8887854.pdf?src-supplier=Avnet
R33 = RC0603FR-0749K9L: RES 49.9K OHM 1% 1/10W 0603; Manufacturer: Yageo; Power Rating: 100mW; Resistance: 49.9kR; Temperature Coefficient: 100ppm/°C; Voltage Rating (DC): 50V; Item Type: Resistor; Supplier 1: Digi-Key; Manufacturer Part Number: RC0603FR-0749K9L; RoHS: Yes; Category: Chip SMD Resistors; Stock 1: 77863; Pricing 1: 1=0.10000, 10=0.02400, 100=0.00970, 1000=0.00436, 2500=0.00378 (USD); Mount: Surface Mount; Case/Package: 0603; Case Code (Metric): 1608; Case Code (Imperial): 0603; Size Code: 0603; Min Operating Temperature: -55°C; Max Operating Temperature: 155°C; Tolerance: 1%; Packaging: Tape and Reel; Package Quantity: 1; Voltage Rating: 50V; Resistor Type: Thick Film; Number of Terminations: 2; Termination: SMD/SMT; Max Power Dissipation: 100mW; Features: Moisture Resistant; Series: RC; Construction: Rectangular; Length: 0.063inch; Width: 0.031inch; Height: 0.022inch; Depth: 0.8mm; Lead Free: Lead Free; Military Standard: Not; RoHS Compliant: Yes; ComponentLink1URL: https://datasheet.ciiva.com/2454/pyu-r-int-thick-7-2454042.pdf?src-supplier=Digi-Key; ComponentLink1Description: https://datasheet.ciiva.com/2454/pyu-r-int-thick-7-2454042.pdf?src-supplier=Digi-Key; ComponentLink2URL: https://datasheet.ciiva.com/2454/pyu-r-int-thick-7-2454043.pdf?src-supplier=Digi-Key; ComponentLink2Description: https://datasheet.ciiva.com/2454/pyu-r-int-thick-7-2454043.pdf?src-supplier=Digi-Key; ComponentLink3URL: https://datasheet.ciiva.com/2454/pyu-r-int-thick-7-2454044.pdf?src-supplier=Digi-Key; ComponentLink3Description: https://datasheet.ciiva.com/2454/pyu-r-int-thick-7-2454044.pdf?src-supplier=Digi-Key; ComponentLink4URL: https://datasheet.ciiva.com/15189/getdatasheetpartid-323805-15189749.pdf?src-supplier=Verical; ComponentLink4Description: https://datasheet.ciiva.com/15189/getdatasheetpartid-323805-15189749.pdf?src-supplier=Verical; Supplier Part Number 1: 311-49.9KHRCT-ND; LCSC Part Number: C114624
R34 = RT0402BRD0724K9L: RES SMD 24.9KOHM 0.1% 1/16W 0402; Manufacturer: Yageo; Item Type: Resistors; Supplier: Future Electronics; LCSC Part Number: C852664; Manufacturer Part Number: RT0402BRD0724K9L; RoHS: Yes; Stock: 40000; Pricing: 10000=0.0362, 20000=0.0356, 30000=0.0353, 50000=0.0349, 100000=0.0341 (USD); ComponentLink1URL: https://datasheet.ciiva.com/2582/pyu-rt-1-to-0-05-rohs-l-4-2582251.pdf?src-supplier=Digikey; ComponentLink1Description: https://datasheet.ciiva.com/2582/pyu-rt-1-to-0-05-rohs-l-4-2582251.pdf?src-supplier=Digikey; ComponentLink2URL: https://datasheet.ciiva.com/12721/pyu-rt-1-to-0-05-rohs-l-4-12721846.pdf?src-supplier=Mouser; ComponentLink2Description: https://datasheet.ciiva.com/12721/pyu-rt-1-to-0-05-rohs-l-4-12721846.pdf?src-supplier=Mouser; ComponentLink3URL: https://datasheet.ciiva.com/46635/pyu-rt-1-to-0-05-rohs-l-5-46635119.pdf?src-supplier=Digikey; ComponentLink3Description: https://datasheet.ciiva.com/46635/pyu-rt-1-to-0-05-rohs-l-5-46635119.pdf?src-supplier=Digikey
R35 = RC0603FR-0727KL: RES 27K OHM 1% 1/10W 0603; Manufacturer: Yageo; Resistance: 27kR; Power Rating: 100mW; Voltage Rating: 50V; Temperature Coefficient: 100ppm/°C; Working Voltage: 75V; Supplier 1: Digi-Key; Manufacturer Part Number: RC0603FR-0727KL; RoHS: Yes; Category: Chip SMD Resistors; Stock 1: 1016971; Pricing 1: 1=0.10000, 10=0.02400, 100=0.00970, 1000=0.00436, 2500=0.00378 (USD); Case/Package: 0603; Number of Pins: 2; Case Code (Metric): 1608; Case Code (Imperial): 0603; Min Operating Temperature: -55°C; Max Operating Temperature: 155°C; Tolerance: 1%; Package Quantity: 1; Packaging: Tape and Reel; Voltage Rating (DC): 50V; Resistor Type: Thick Film; Number of Terminations: 2; Termination: SMD/SMT; Max Power Dissipation: 100mW; Features: Moisture Resistant; Series: RC; Resistance Tolerance: 1%; Technology: THICK FILM; Construction: Rectangular; Length: 0.063inch; Width: 0.031inch; Height: 0.022inch; Depth: 0.8mm; RoHS Compliant: Yes; REACH SVHC: No SVHC; Military Standard: Not; Lead Free: Lead Free; ComponentLink1URL: https://datasheet.ciiva.com/11808/0900766b80f96399-11808540.pdf?src-supplier=RSComponents; ComponentLink1Description: https://datasheet.ciiva.com/11808/0900766b80f96399-11808540.pdf?src-supplier=RSComponents; ComponentLink2URL: https://datasheet.ciiva.com/2453/pyu-r-int-thick-7-2453968.pdf?src-supplier=Digi-Key; ComponentLink2Description: https://datasheet.ciiva.com/2453/pyu-r-int-thick-7-2453968.pdf?src-supplier=Digi-Key; ComponentLink3URL: https://datasheet.ciiva.com/2453/pyu-r-int-thick-7-2453969.pdf?src-supplier=Digi-Key; ComponentLink3Description: https://datasheet.ciiva.com/2453/pyu-r-int-thick-7-2453969.pdf?src-supplier=Digi-Key; ComponentLink4URL: https://datasheet.ciiva.com/7746/443971-7746311.pdf?src-supplier=Element14; ComponentLink4Description: https://datasheet.ciiva.com/7746/443971-7746311.pdf?src-supplier=Element14; ComponentLink5URL: https://datasheet.ciiva.com/7746/443971-7746312.pdf?src-supplier=Element14; ComponentLink5Description: https://datasheet.ciiva.com/7746/443971-7746312.pdf?src-supplier=Element14; ComponentLink6URL: https://datasheet.ciiva.com/15159/getdatasheetpartid-45811-15159564.pdf?src-supplier=Verical; ComponentLink6Description: https://datasheet.ciiva.com/15159/getdatasheetpartid-45811-15159564.pdf?src-supplier=Verical; ComponentLink7URL: https://datasheet.ciiva.com/2453/pyu-r-int-thick-7-2453967.pdf?src-supplier=Digi-Key; ComponentLink7Description: https://datasheet.ciiva.com/2453/pyu-r-int-thick-7-2453967.pdf?src-supplier=Digi-Key; ComponentLink8URL: https://datasheet.ciiva.com/46412/443971-46412847.pdf?src-supplier=Element14; ComponentLink8Description: https://datasheet.ciiva.com/46412/443971-46412847.pdf?src-supplier=Element14; Supplier Part Number 1: 311-27.0KHRCT-ND; LCSC Part Number: C114614
R36 = RC0402FR-0743KL: RES 43K OHM 1% 1/16W 0402; Manufacturer: Yageo; Resistance: 43kR; Power Rating: 63mW; Voltage Rating: 50V; Temperature Coefficient: 100ppm/°C; Item Type: Resistor; Supplier 1: Digi-Key; Manufacturer Part Number: RC0402FR-0743KL; RoHS: Yes; Category: Chip SMD Resistors; Stock 1: 923044; Pricing 1: 1=0.10000, 10=0.01400, 100=0.00580, 1000=0.00262, 2500=0.00228, 5000=0.00188 (USD); Case/Package: 0402; Case Code (Metric): 1005; Case Code (Imperial): 0402; Weight: 2.3E-05oz; Size Code: 0402; Min Operating Temperature: -55°C; Max Operating Temperature: 155°C; Resistor Type: Thick Film; Package Quantity: 1; Tolerance: 1%; Packaging: Tape and Reel; Number of Terminations: 2; Termination: SMD/SMT; Max Power Dissipation: 63mW; Voltage Rating (DC): 50V; Features: Moisture Resistant; Series: RC; Construction: Rectangular; Resistance Tolerance: 1%; Technology: THICK FILM; Length: 1mm; Width: 0.02inch; Height: 0.016inch; Depth: 0.5mm; RoHS Compliant: Yes; Military Standard: Not; Lead Free: Lead Free; ComponentLink1URL: https://datasheet.ciiva.com/11819/0900766b80c66297-11819515.pdf?src-supplier=RSComponents; ComponentLink1Description: https://datasheet.ciiva.com/11819/0900766b80c66297-11819515.pdf?src-supplier=RSComponents; ComponentLink2URL: https://datasheet.ciiva.com/7850/1018594-7850009.pdf?src-supplier=Element14; ComponentLink2Description: https://datasheet.ciiva.com/7850/1018594-7850009.pdf?src-supplier=Element14; ComponentLink3URL: https://datasheet.ciiva.com/7850/1018594-7850008.pdf?src-supplier=Element14; ComponentLink3Description: https://datasheet.ciiva.com/7850/1018594-7850008.pdf?src-supplier=Element14; ComponentLink4URL: https://datasheet.ciiva.com/2453/pyu-r-int-thick-7-2453665.pdf?src-supplier=Digi-Key; ComponentLink4Description: https://datasheet.ciiva.com/2453/pyu-r-int-thick-7-2453665.pdf?src-supplier=Digi-Key; ComponentLink5URL: https://datasheet.ciiva.com/2453/pyu-r-int-thick-7-2453666.pdf?src-supplier=Digi-Key; ComponentLink5Description: https://datasheet.ciiva.com/2453/pyu-r-int-thick-7-2453666.pdf?src-supplier=Digi-Key; ComponentLink6URL: https://datasheet.ciiva.com/2453/pyu-r-int-thick-7-2453664.pdf?src-supplier=Digi-Key; ComponentLink6Description: https://datasheet.ciiva.com/2453/pyu-r-int-thick-7-2453664.pdf?src-supplier=Digi-Key; Supplier Part Number 1: 311-43.0KLRCT-ND; LCSC Part Number: C185415
U1 = LP38692MP-5.0/NOPB: IC REG LINEAR 5V 1A SOT223-5; Manufacturer: Texas Instruments; Item Type: LDO; Supplier: Mouser; Supplier Part Number: 926-38692MP-5.0/NOPB; Manufacturer Part Number: LP38692MP-5.0/NOPB; RoHS: Yes; Stock: 1461; Pricing: 1=2.01, 10=1.71, 50=1.71, 100=1.45, 1000=0.91, 10000=0.888 (USD); Thickness: 1.6mm; ComponentLink1URL: https://datasheet.ciiva.com/6596/lp38690-6596184.pdf?src-supplier=Digikey; ComponentLink1Description: https://datasheet.ciiva.com/6596/lp38690-6596184.pdf?src-supplier=Digikey; ComponentLink2URL: https://datasheet.ciiva.com/6596/lp38690-6596185.pdf?src-supplier=Digikey; ComponentLink2Description: https://datasheet.ciiva.com/6596/lp38690-6596185.pdf?src-supplier=Digikey; ComponentLink3URL: https://datasheet.ciiva.com/6596/lp38690-6596186.pdf?src-supplier=Digikey; ComponentLink3Description: https://datasheet.ciiva.com/6596/lp38690-6596186.pdf?src-supplier=Digikey; ComponentLink4URL: https://datasheet.ciiva.com/14278/lp38692-14278796.pdf?src-supplier=Avnet; ComponentLink4Description: https://datasheet.ciiva.com/14278/lp38692-14278796.pdf?src-supplier=Avnet; ComponentLink5URL: https://datasheet.ciiva.com/22704/1854710-22704677.pdf?src-supplier=Element14; ComponentLink5Description: https://datasheet.ciiva.com/22704/1854710-22704677.pdf?src-supplier=Element14; LCSC Part Number: C28191
U7 = TPS552882QRPMRQ1: 36-V, 16-A buck-boost converter, AEC-Q100 qualified 26-VQFN-HR -40 to 150; Manufacturer: Texas Instruments; Topology: 6153TopologyType; Max Duty Cycle: 100%; Max Supply Voltage: 36V; Min Supply Voltage: 2.7V; Nominal Supply Current: 760uA; Number of Outputs: 1NUMBER; Output Current: 16A; LCSC Part Number: C2876594; Manufacturer Part Number: TPS552882QRPMRQ1; Supplier: Digikey; Supplier Part Number: 296-TPS552882QRPMRQ1CT-ND; RoHS: No; Category: Voltage Regulators - Switching; Stock: 2496; Pricing: 1=5.99, 10=4.592, 25=4.2428, 100=3.8588, 250=3.67568, 500=3.56532, 1000=3.4745 (USD); Pins: 26NUMBER; Min Operating Temperature: -40°C; Max Operating Temperature: 150°C; Length: 4mm; Width: 3.5mm; Height: 1mm; Thickness: 900um